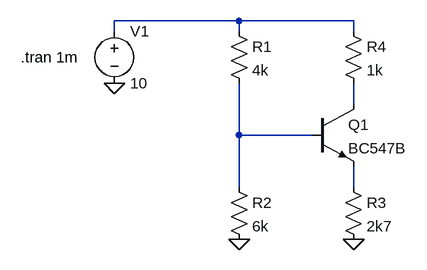
[diagram p0: schematic exemplu_polarizare.asc]
exemplu_polarizare.asc, the LTspice schematic file:
Version 4
SHEET 1 880 680
WIRE 16 -16 -176 -16
WIRE 192 -16 16 -16
WIRE -176 0 -176 -16
WIRE 16 0 16 -16
WIRE 192 0 192 -16
WIRE 192 112 192 80
WIRE 16 160 16 80
WIRE 128 160 16 160
WIRE 16 240 16 160
WIRE 192 240 192 208
FLAG 16 320 0
FLAG 192 320 0
FLAG -176 80 0
SYMBOL npn 128 112 R0
SYMATTR InstName Q1
SYMATTR Value BC547B
SYMBOL res 0 -16 R0
SYMATTR InstName R1
SYMATTR Value 4k
SYMBOL res 0 224 R0
SYMATTR InstName R2
SYMATTR Value 6k
SYMBOL res 176 224 R0
SYMATTR InstName R3
SYMATTR Value 2k7
SYMBOL res 176 -16 R0
SYMATTR InstName R4
SYMATTR Value 1k
SYMBOL voltage -176 -16 R0
WINDOW 123 0 0 Left 2
WINDOW 39 0 0 Left 2
SYMATTR InstName V1
SYMATTR Value 10
TEXT -320 40 Left 2 !.tran 1m

The netlist it stands for:
* exemplu_polarizare.asc
Q1 N002 N003 N004 0 BC547B
R1 N001 N003 4k
R2 N003 0 6k
R3 N004 0 2k7
R4 N001 N002 1k
V1 N001 0 10
.model NPN NPN
.model PNP PNP
.lib standard.bjt
.tran 1m
.backanno
.end